# EasyEDA schematic SCH_Hexbie-2026-10-17.json
TITLE: Sheet_1; REV: 1.0; Date: 2026-10-07; Sheet: 1/1; Drawn By: rottpan26007; Company: Your Company
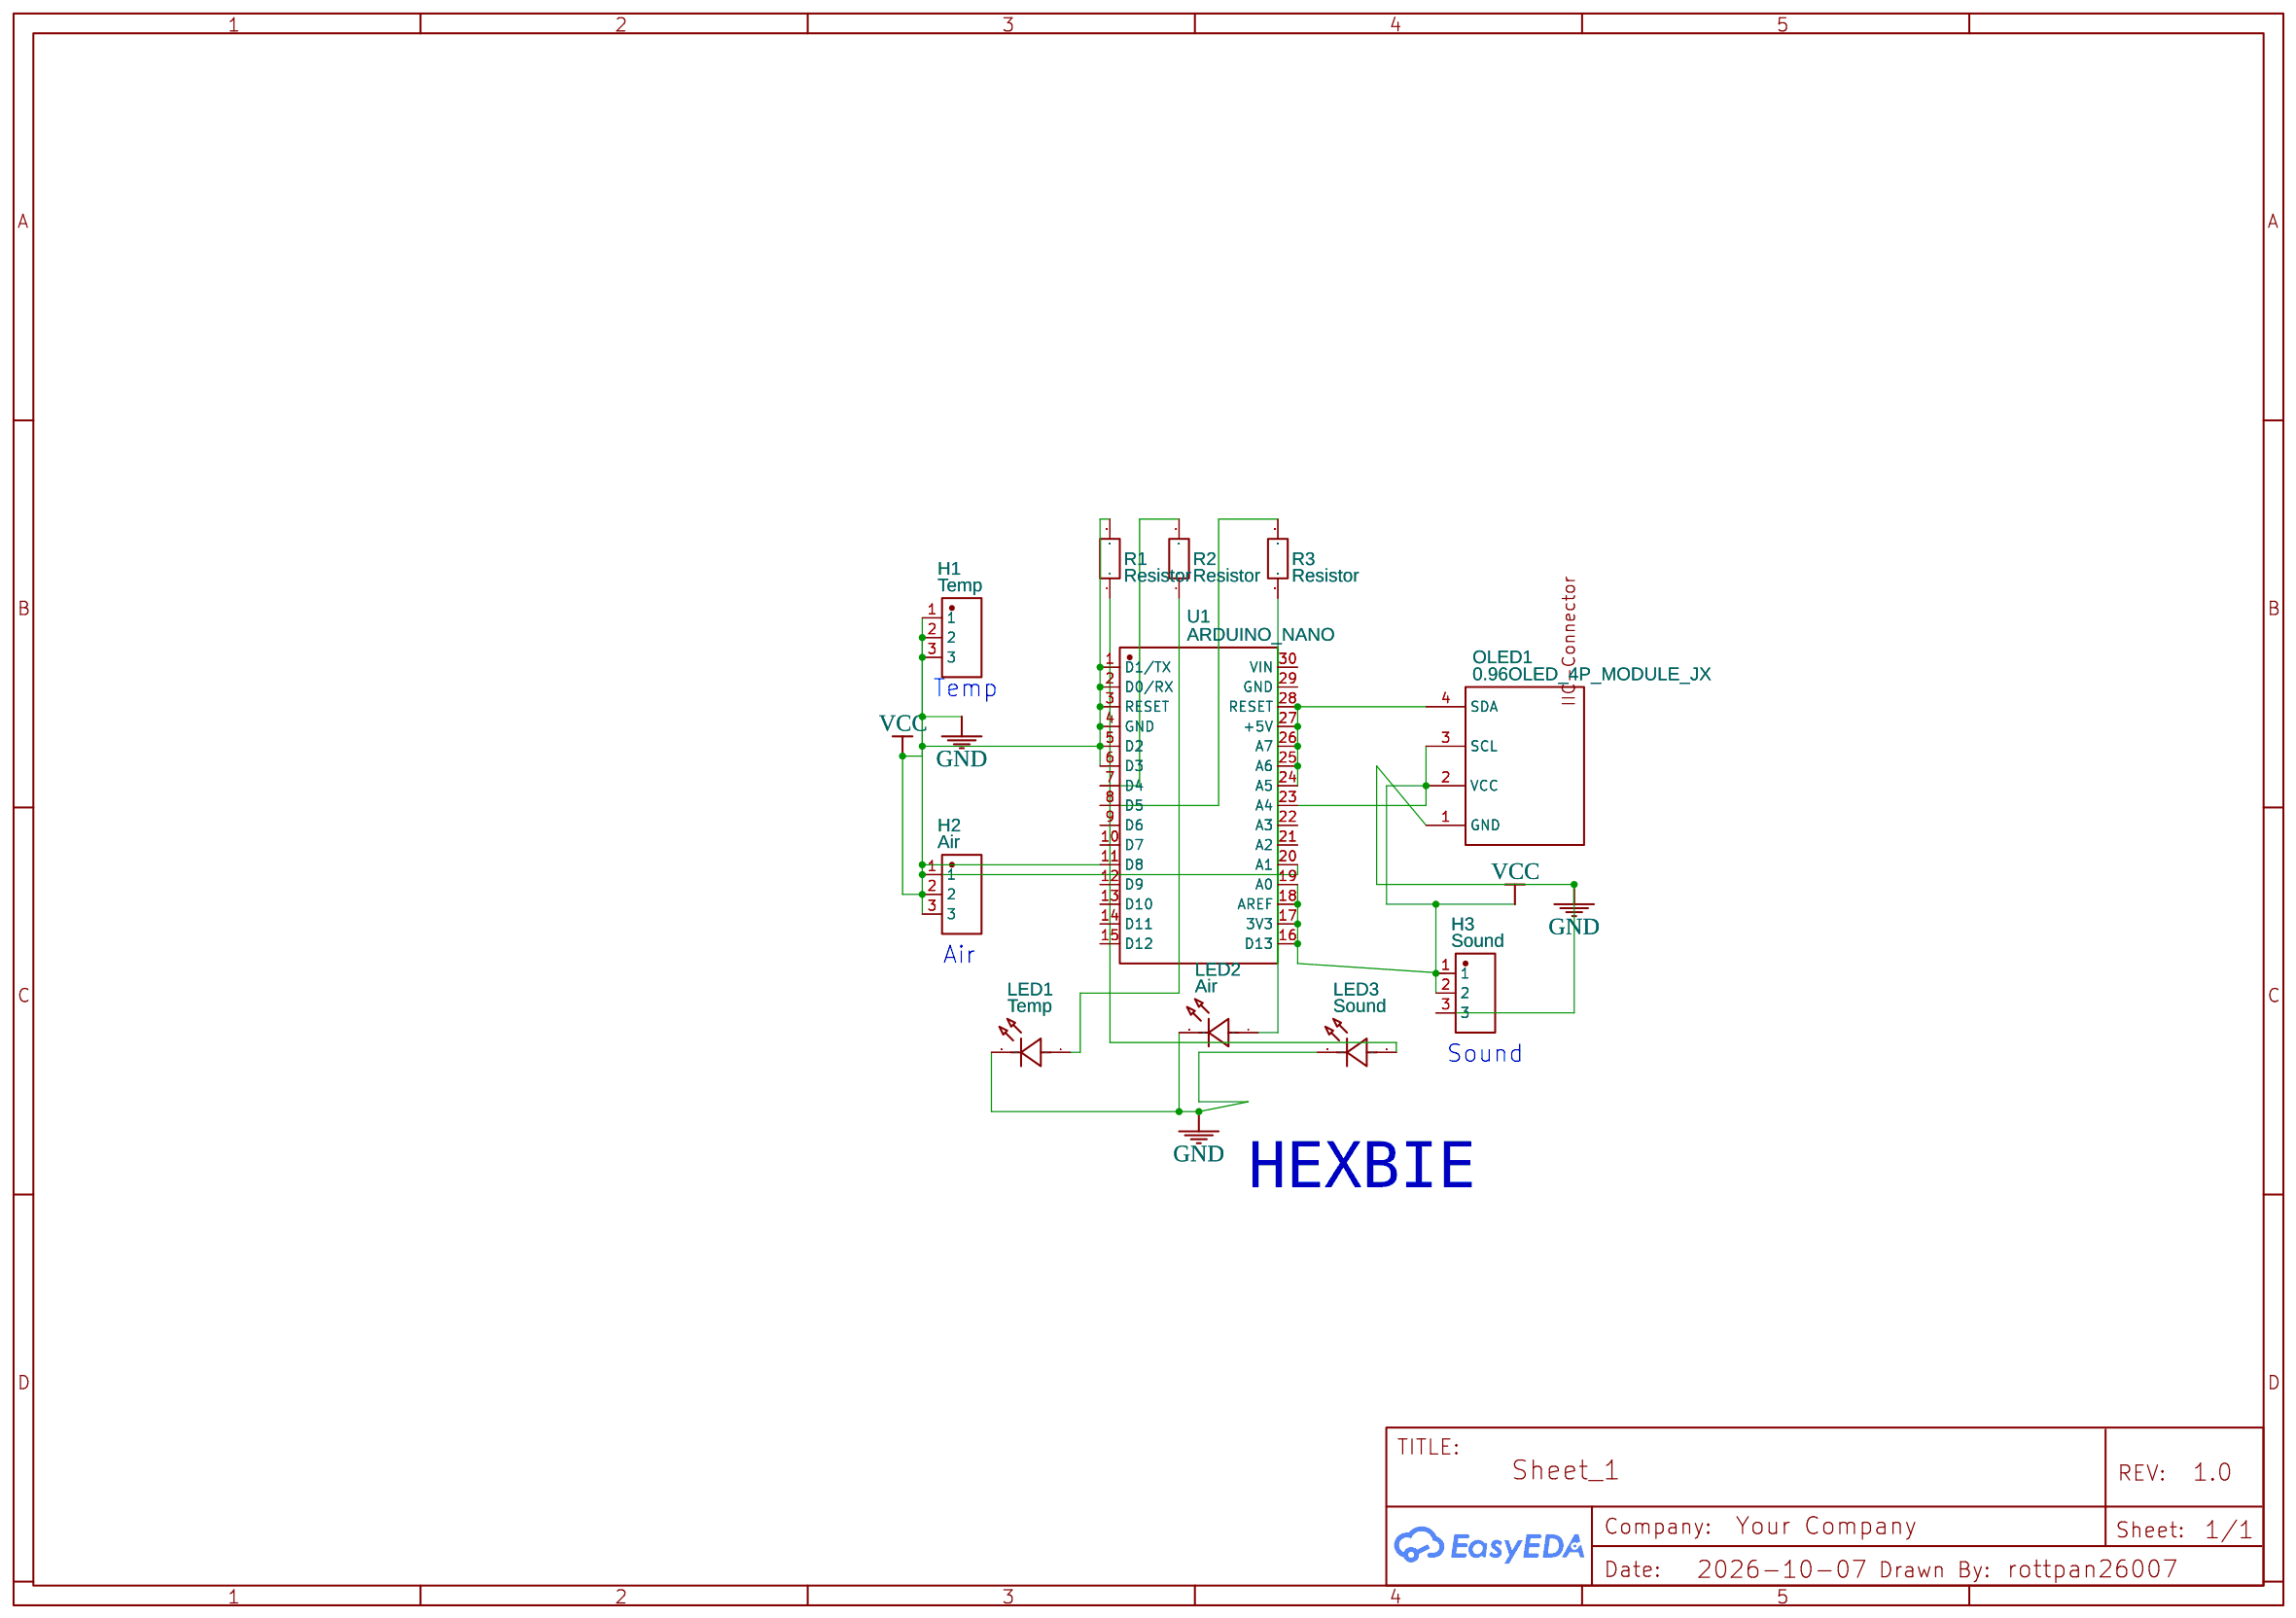
[diagram p0: schematic sheet]

## Parts
H1  Temp  [HDR-TH_3P-P2.54-V-M-1]
H2  Air  [HDR-TH_3P-P2.54-V-M-1]
H3  Sound  [HDR-TH_3P-P2.54-V-M-1]
LED1  Temp  [LED1206-FD]
LED2  Air  [LED1206-FD]
LED3  Sound  [LED1206-FD]
OLED1  0.96OLED_4P_MODULE_JX  [0.96OLED_4P]
R1  Resistor  [R0603]
R2  Resistor  [R0603]
R3  Resistor  [R0603]
U1  ARDUINO_NANO  [COMM-TH_ARDUINO_NANO]

## Library data of the parts
H1-H3 = HX PH254-01-03-Z-L11.5 PCB PIN HEADER: Supplier: LCSC; Supplier Part: C52016391; Manufacturer: hanxia(韩下); Manufacturer Part: HX PH254-01-03-Z-L11.5 pcb pin header; JLCPCB Part Class: Extended Part; Contributor: lcsc
LED1-LED3 = 15-21/G6C-FM1N2B/3T: Supplier: LCSC; Supplier Part: C2985977; Manufacturer: EVERLIGHT(亿光); JLCPCB Part Class: Extended Part; Contributor: lcsc
OLED1 = 0.96OLED_4P_MODULE_JX: Contributor: LCSC; Supplier: LCSC; Supplier Part: C9900004566; Manufacturer: null; JLCPCB Part Class: Extended Part
R1-R3 = 贴片电阻CHIPRESISTORS: Contributor: lcsc; Supplier: LCSC; Supplier Part: C9900014833; Manufacturer: null; Manufacturer Part: 贴片电阻ChipResistors; JLCPCB Part Class: Extended Part
U1 = ARDUINO_NANO: Contributor: lcsc; Supplier: LCSC; Supplier Part: C9900017879; Manufacturer: null; JLCPCB Part Class: Extended Part

## Nets
GND: H1.1 H1.2 H1.3 H2.1 H2.2 H2.3 H3.1 H3.2 H3.3 LED1.2(K) LED2.2(K) LED3.2(K) OLED1.1(GND) OLED1.2(VCC) OLED1.3(SCL) R1.2 U1.1(D1/TX) U1.2(D0/RX) U1.3(RESET) U1.4(GND) U1.5(D2) U1.6(D3) U1.11(D8) U1.20(A1) U1.23(A4)
Net-(LED1-1): LED1.1(A) R2.1
Net-(LED2-1): LED2.1(A) R3.1
Net-(LED3-1): LED3.1(A) R1.1
Net-(OLED1-4): OLED1.4(SDA) U1.24(A5) U1.25(A6) U1.26(A7) U1.27(+5V) U1.28(RESET)
Net-(R2-2): R2.2 U1.7(D4)
Net-(R3-2): R3.2 U1.8(D5)
Net-(U1-16): U1.16(D13) U1.17(3V3) U1.18(AREF) U1.19(A0)

Not connected (* = marked no-connect by the designer): U1 9(D6) 10(D7) 12(D9) 13(D10) 14(D11) 15(D12) 21(A2) 22(A3) 29(GND) 30(VIN)

## Notes on the sheet
- Temp
- Air
- Sound
- HEXBIE
